# Altium project MainController.PrjPcb
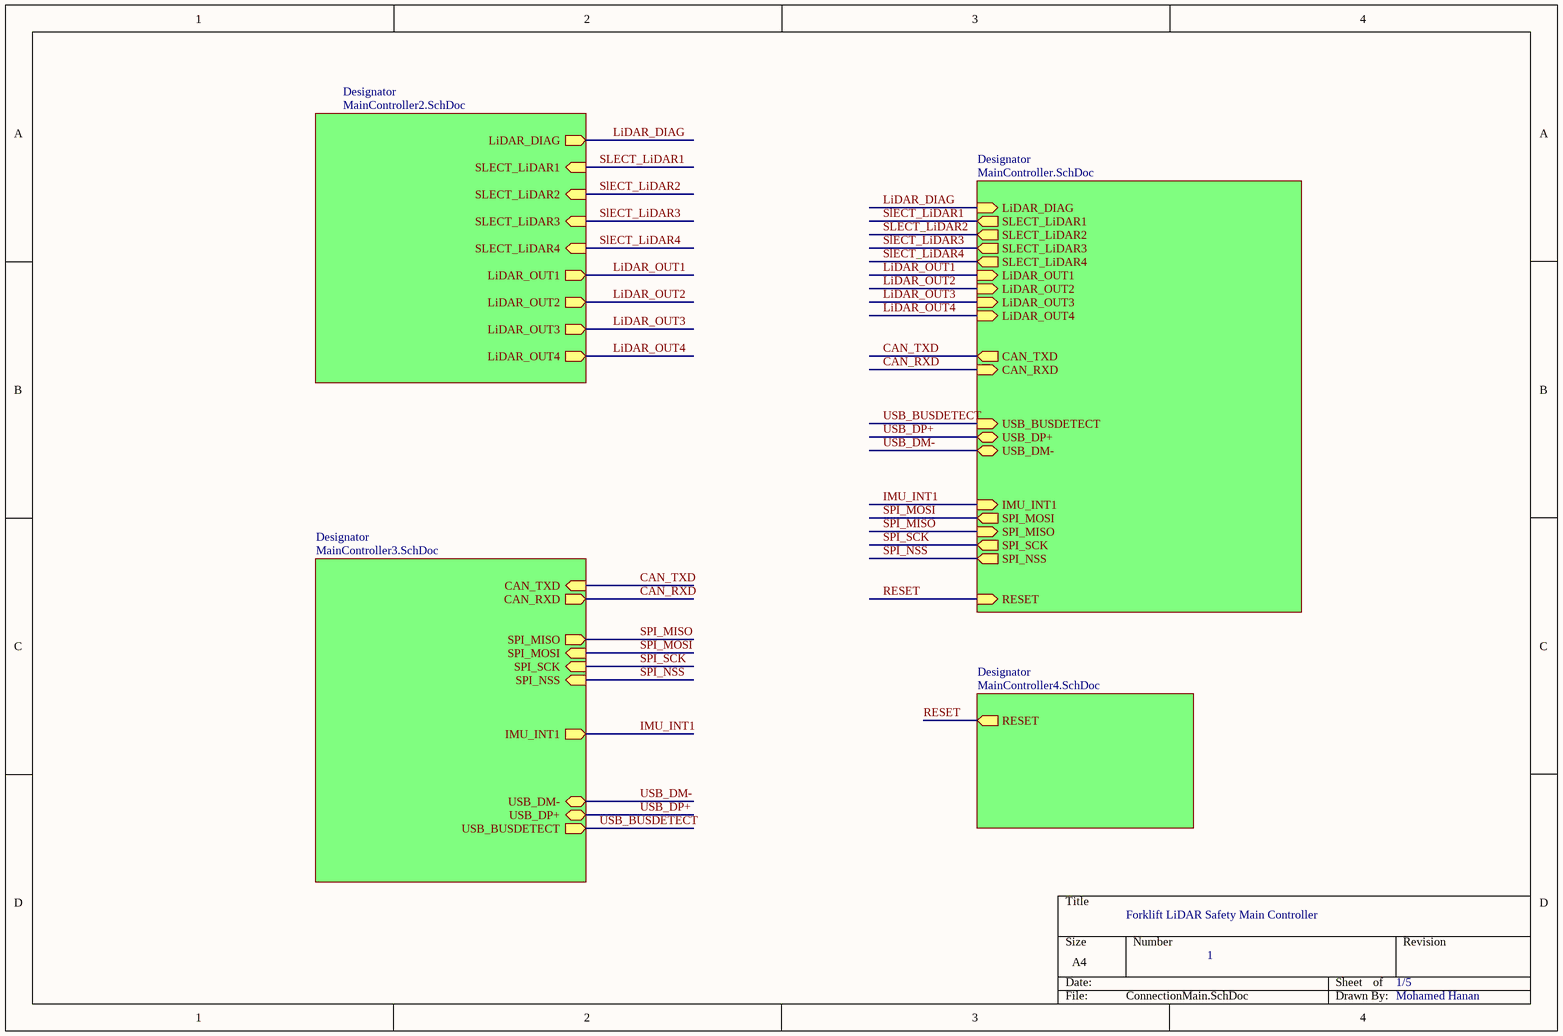
[diagram p0: ConnectionMain.SchDoc]
5 sheets, 112 parts. Net scope: hierarchical (ports join the sheet entries above them; power ports are global).
Board file: MainController.PcbDoc
Sheets:
  ConnectionMain.SchDoc
    Designator = MainController.SchDoc
    Designator = MainController2.SchDoc
    Designator = MainController3.SchDoc
    Designator = MainController4.SchDoc

## Sheet ConnectionMain.SchDoc
size A4; SheetNumber: 1; SheetTotal: 5

### Sub-sheets
Designator = MainController.SchDoc: LiDAR_DIAG (in), SLECT_LiDAR1 (out), SLECT_LiDAR2 (out), SLECT_LiDAR3 (out), SLECT_LiDAR4 (out), LiDAR_OUT1 (in), LiDAR_OUT2 (in), LiDAR_OUT3 (in), LiDAR_OUT4 (in), USB_DP+ (bidir), USB_DM- (bidir), IMU_INT1 (in), SPI_MOSI (out), SPI_MISO (in), SPI_SCK (out), SPI_NSS (out), CAN_TXD (out), CAN_RXD (in), USB_BUSDETECT (in), RESET (in)
Designator = MainController2.SchDoc: SLECT_LiDAR1 (in), SLECT_LiDAR2 (in), SLECT_LiDAR3 (in), SLECT_LiDAR4 (in), LiDAR_OUT1 (out), LiDAR_OUT2 (out), LiDAR_OUT3 (out), LiDAR_OUT4 (out), LiDAR_DIAG (out)
Designator = MainController3.SchDoc: CAN_TXD (in), CAN_RXD (out), USB_BUSDETECT (out), USB_DM- (bidir), USB_DP+ (bidir), IMU_INT1 (out), SPI_MISO (out), SPI_MOSI (in), SPI_SCK (in), SPI_NSS (in)
Designator = MainController4.SchDoc: RESET (out)

### Nets
CAN_RXD: sheet Designator/CAN_RXD, sheet Designator/CAN_RXD
CAN_TXD: sheet Designator/CAN_TXD, sheet Designator/CAN_TXD
IMU_INT1: sheet Designator/IMU_INT1, sheet Designator/IMU_INT1
LiDAR_DIAG: sheet Designator/LiDAR_DIAG, sheet Designator/LiDAR_DIAG
LiDAR_OUT1: sheet Designator/LiDAR_OUT1, sheet Designator/LiDAR_OUT1
LiDAR_OUT2: sheet Designator/LiDAR_OUT2, sheet Designator/LiDAR_OUT2
LiDAR_OUT3: sheet Designator/LiDAR_OUT3, sheet Designator/LiDAR_OUT3
LiDAR_OUT4: sheet Designator/LiDAR_OUT4, sheet Designator/LiDAR_OUT4
RESET: sheet Designator/RESET, sheet Designator/RESET
SLECT_LiDAR1: sheet Designator/SLECT_LiDAR1, sheet Designator/SLECT_LiDAR1
SlECT_LiDAR2: sheet Designator/SLECT_LiDAR2, sheet Designator/SLECT_LiDAR2
SlECT_LiDAR3: sheet Designator/SLECT_LiDAR3, sheet Designator/SLECT_LiDAR3
SlECT_LiDAR4: sheet Designator/SLECT_LiDAR4, sheet Designator/SLECT_LiDAR4
SPI_MISO: sheet Designator/SPI_MISO, sheet Designator/SPI_MISO
SPI_MOSI: sheet Designator/SPI_MOSI, sheet Designator/SPI_MOSI
SPI_NSS: sheet Designator/SPI_NSS, sheet Designator/SPI_NSS
SPI_SCK: sheet Designator/SPI_SCK, sheet Designator/SPI_SCK
USB_BUSDETECT: sheet Designator/USB_BUSDETECT, sheet Designator/USB_BUSDETECT
USB_DM-: sheet Designator/USB_DM-, sheet Designator/USB_DM-
USB_DP+: sheet Designator/USB_DP+, sheet Designator/USB_DP+

### Notes on the sheet
- Forklift LiDAR Safety Main Controller
- 1
- 1/5
- Mohamed Hanan

## Sheet MainController.SchDoc
size A4; SheetNumber: 2; SheetTotal: 5
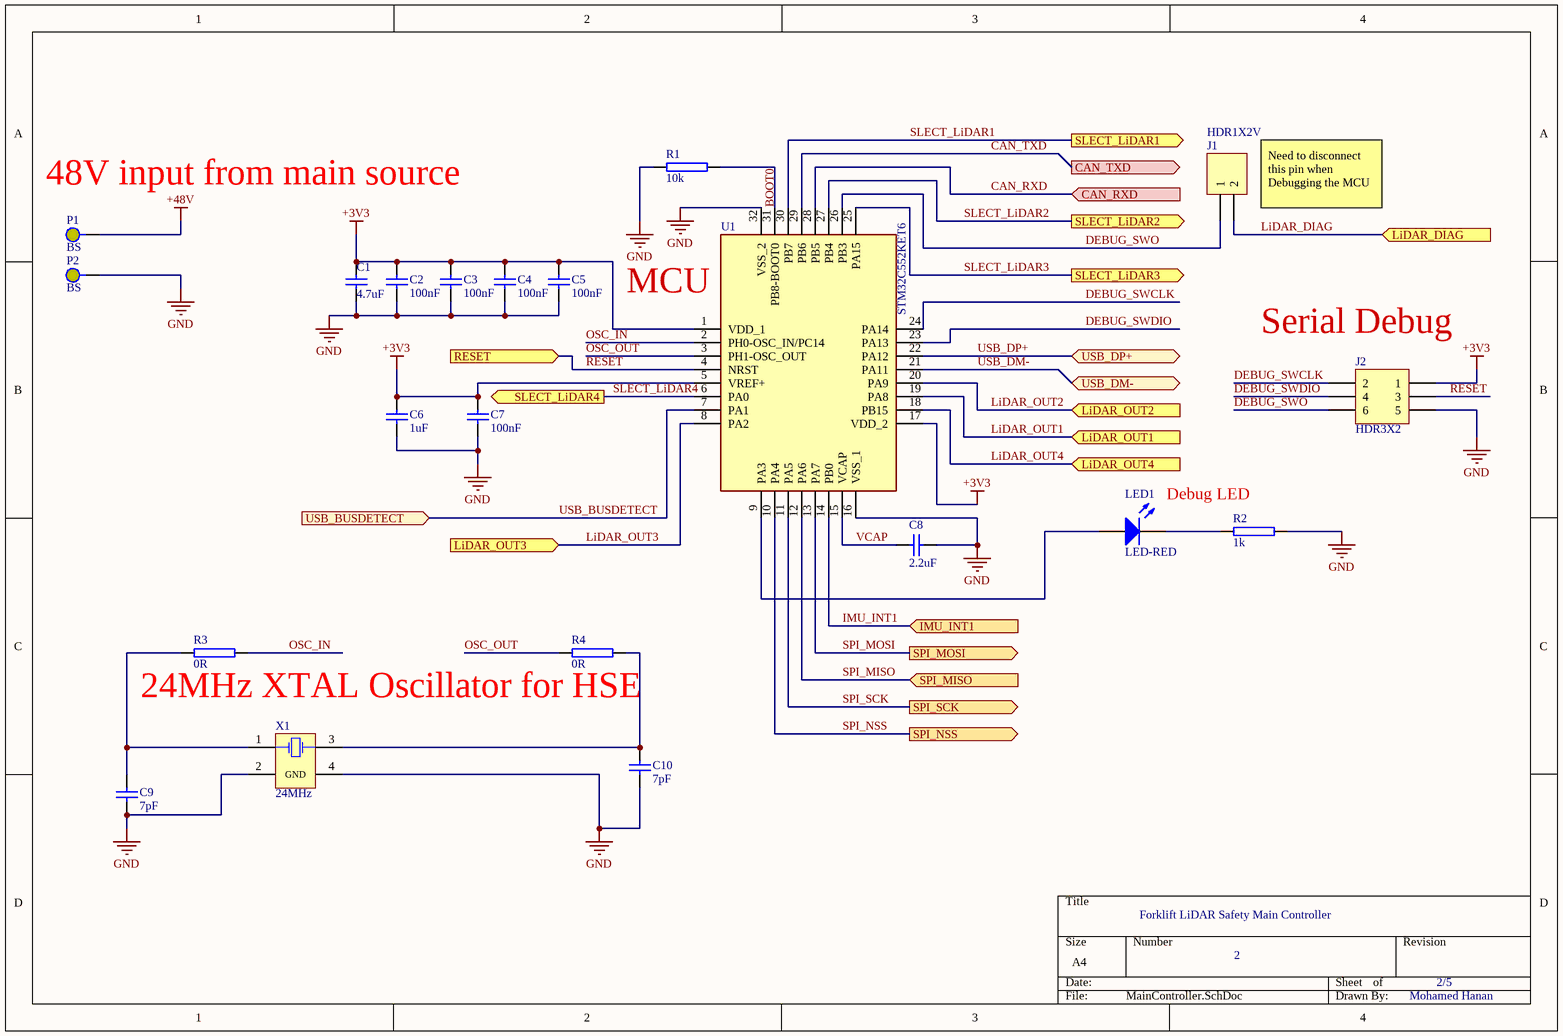
[diagram p1: MainController.SchDoc]

### Parts
C1  4.7uF  [CAP_1206]
C2  100nF  [CAP_0805]
C3  100nF  [CAP_0805]
C4  100nF  [CAP_0805]
C5  100nF  [CAP_0805]
C6  1uF  [CAP_0805]
C7  100nF  [CAP_0805]
C8  2.2uF  [CAP_0805]
C9  7pF  [CAP_0805]
C10  7pF  [CAP_0805]
J1  HDR1X2V  [HDR1X2_AUT]
J2  HDR3X2  [HDR2X3_AUT]
LED1  LED-RED  [LED1206R]
P1  BS  [Banana_AUT]
P2  BS  [Banana_AUT]
R1  10k  [RES_0805]
R2  1k  [RES_1206]
R3  0R  [RES_0805]
R4  0R  [RES_0805]
U1  STM32C552KET6  [32A_M]
X1  24MHz  [CX2520SB]

### Ports
CAN_RXD (in, see ConnectionMain[3B], MainController3[1A]), CAN_TXD (out, see ConnectionMain[3B], MainController3[1A]), IMU_INT1 (in, see ConnectionMain[3B], MainController3[4C]), LiDAR_DIAG (in, see ConnectionMain[3A], MainController2[3B]), LiDAR_OUT1 (in, see ConnectionMain[3B], MainController2[3C]), LiDAR_OUT2 (in, see ConnectionMain[3B], MainController2[3C]), LiDAR_OUT3 (in, see ConnectionMain[3B], MainController2[3D]), LiDAR_OUT4 (in, see ConnectionMain[3B], MainController2[3D]), RESET (in, see ConnectionMain[3C], MainController4[3C]), SLECT_LiDAR1 (out, see ConnectionMain[3A], MainController2[1B]), SLECT_LiDAR2 (out, see ConnectionMain[3A], MainController2[1B]), SLECT_LiDAR3 (out, see ConnectionMain[3A], MainController2[1B]), SLECT_LiDAR4 (out, see ConnectionMain[3B], MainController2[1B]), SPI_MISO (in, see ConnectionMain[3C], MainController3[4B]), SPI_MOSI (out, see ConnectionMain[3C], MainController3[4B]), SPI_NSS (out, see ConnectionMain[3C], MainController3[4B]), SPI_SCK (out, see ConnectionMain[3C], MainController3[4B]), USB_BUSDETECT (in, see ConnectionMain[3B], MainController3[2C]), USB_DM- (bidir, see ConnectionMain[3B], MainController3[2C]), USB_DP+ (bidir, see ConnectionMain[3B], MainController3[2C])

### Nets
+3V3: C1.2 C2.2 C3.2 C4.2 C5.2 C6.2 C7.2 J2.1 U1.1(VDD_1) U1.5(VREF+) U1.17(VDD_2)
+48V: P1.1
GND: C1.1 C2.1 C3.1 C4.1 C5.1 C6.1 C7.1 C8.2 C9.2 C10.2 J2.5 P2.1 R1.1 R2.2 U1.16(VSS_1) U1.32(VSS_2) X1.2(GND) X1.4(GND)
BOOT0: R1.2 U1.31(PB8-BOOT0)
CAN_RXD: U1.28(PB5) ; port CAN_RXD
CAN_TXD: U1.29(PB6) ; port CAN_TXD
DEBUG_SWCLK: J2.2 U1.24(PA14)
DEBUG_SWDIO: J2.4 U1.23(PA13)
DEBUG_SWO: J1.1 J2.6 U1.26(PB3)
IMU_INT1: U1.14(PB0) ; port IMU_INT1
LiDAR_DIAG: J1.2 ; port LiDAR_DIAG
LiDAR_OUT1: U1.19(PA8) ; port LiDAR_OUT1
LiDAR_OUT2: U1.20(PA9) ; port LiDAR_OUT2
LiDAR_OUT3: U1.8(PA2) ; port LiDAR_OUT3
LiDAR_OUT4: U1.18(PB15) ; port LiDAR_OUT4
OSC_IN: R3.2 U1.2(PH0-OSC_IN/PC14)
OSC_OUT: R4.1 U1.3(PH1-OSC_OUT)
RESET: J2.3 U1.4(NRST) ; port RESET
SLECT_LiDAR1: U1.30(PB7) ; port SLECT_LiDAR1
SlECT_LiDAR2: U1.27(PB4) ; port SLECT_LiDAR2
SlECT_LiDAR3: U1.25(PA15) ; port SLECT_LiDAR3
SlECT_LiDAR4: U1.6(PA0) ; port SLECT_LiDAR4
SPI_MISO: U1.12(PA6) ; port SPI_MISO
SPI_MOSI: U1.13(PA7) ; port SPI_MOSI
SPI_NSS: U1.10(PA4) ; port SPI_NSS
SPI_SCK: U1.11(PA5) ; port SPI_SCK
USB_BUSDETECT: U1.7(PA1) ; port USB_BUSDETECT
USB_DM-: U1.21(PA11) ; port USB_DM-
USB_DP+: U1.22(PA12) ; port USB_DP+
VCAP: C8.1 U1.15(VCAP)
NetC9_1: C9.1 R3.1 X1.1(OSC1)
NetC10_1: C10.1 R4.2 X1.3(OSC2)
NetLED1_A: LED1.A U1.9(PA3)
NetLED1_K: LED1.K R2.1

### Notes on the sheet
- (near P1) 48V input from main source
- (near J1) Need to disconnect this pin when Debugging the MCU
- (near U1) MCU
- (near J2) Serial Debug
- Debug LED
- 24MHz XTAL Oscillator for HSE
- Forklift LiDAR Safety Main Controller
- 2
- 2/5
- Mohamed Hanan

### Library data of the parts
C1 = CAPN 1206: Non Polarized Capacitor, SMD, 1206
C2-C10 = CAPN 0805: Non Polarized Capacitor, SMD, 0805
J1 = HDR1X2V: Header, Plug, 2.54mm, 2 Pins, Straight; Supplier 1: Farnell; Supplier Part Number 1: 2254030
J2 = HDR3X2: Header, 3-Pin, Dual row, 2.54mm Pitch, Straight; Supplier 1: Farnell; Supplier Part Number 1: 9733574
LED1 = SMD 1206 LED-RED: RED LED, Case 1206; Supplier 1: Farnell; Supplier Part Number 1: 8530017
P1 P2 = Banana Socket: Banana Socket, 4mm, Panel, Black, 10A; Supplier 1: Farnell; Supplier Part Number 1: 1101113
R1 R3 R4 = Resistor 0805: Resistor, SMD, 0805
R2 = Resistor 1206: Resistor, SMD, 1206
U1 = STM32C552KET6: Arm? Cortex?-M33 32-bit MCU with FPU, 144 MHz, 593 CoreMark?, up to 512Kbyte dualbank flash memory, 128-Kbyte RAM; Manufacturer_Name: STMicroelectronics; Geometry.Height: 1.6mm; Manufacturer_Part_Number: STM32C552KET6; Mouser Part Number: *; Mouser Price/Stock: *; Arrow Part Number: *; Arrow Price/Stock: *; Datasheet Link: https://www.st.com/resource/en/datasheet/stm32c551cc.pdf; Supplier 1: DigiKey; Supplier Part Number 1: 497-STM32C552KET6-ND
X1 = CX2520SB24000D0FLJZZ: Crystals, 24MHz; Supplier 1: Farnell; Supplier Part Number 1: 1657889

## Sheet MainController2.SchDoc
size A4; SheetNumber: 3; SheetTotal: 5
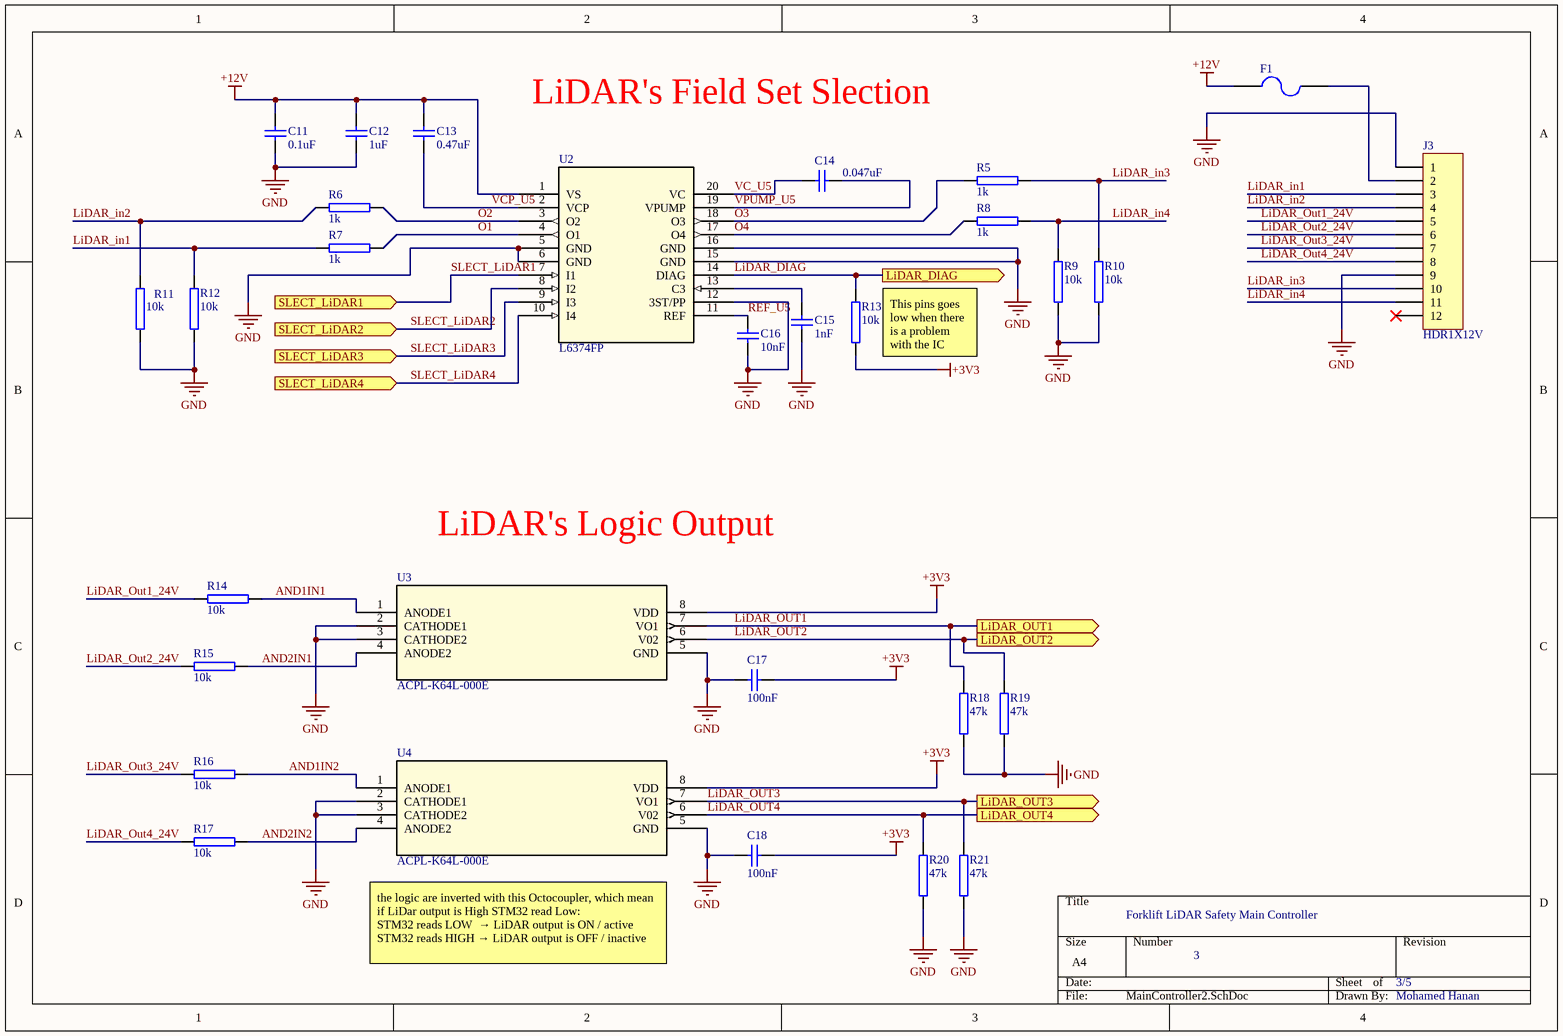
[diagram p2: MainController2.SchDoc]

### Parts
C11  0.1uF  [CAP_0805]
C12  1uF  [CAP_0805]
C13  0.47uF  [CAP_0805]
C14  0.047uF  [CAP_1206]
C15  1nF  [CAP_0805]
C16  10nF  [CAP_0805]
C17  100nF  [CAP_0805]
C18  100nF  [CAP_0805]
F1  1206L035/16YR  [MC36207]  (value not drawn)
J3  HDR1X12V  [HDR1X12_AUT]
R5  1k  [RES_1206]
R6  1k  [RES_1206]
R7  1k  [RES_1206]
R8  1k  [RES_1206]
R9  10k  [RES_0805]
R10  10k  [RES_0805]
R11  10k  [RES_0805]
R12  10k  [RES_0805]
R13  10k  [RES_0805]
R14  10k  [RES_0805]
R15  10k  [RES_0805]
R16  10k  [RES_0805]
R17  10k  [RES_0805]
R18  47k  [RES_0805]
R19  47k  [RES_0805]
R20  47k  [RES_0805]
R21  47k  [RES_0805]
U2  L6374FP  [20S_M]
U3  ACPL-K64L-000E  [STRETCHED_SO-8_AVA]
U4  ACPL-K64L-000E  [STRETCHED_SO-8_AVA]

### Ports
LiDAR_DIAG (out, see ConnectionMain[2A], MainController[4A]), LiDAR_OUT1 (out, see ConnectionMain[2B], MainController[3B]), LiDAR_OUT2 (out, see ConnectionMain[2B], MainController[3B]), LiDAR_OUT3 (out, see ConnectionMain[2B], MainController[2C]), LiDAR_OUT4 (out, see ConnectionMain[2B], MainController[3B]), SLECT_LiDAR1 (in, see ConnectionMain[2A], MainController[3A]), SLECT_LiDAR2 (in, see ConnectionMain[2A], MainController[3A]), SLECT_LiDAR3 (in, see ConnectionMain[2A], MainController[3B]), SLECT_LiDAR4 (in, see ConnectionMain[2A], MainController[2B])

### Nets
+3V3: C17.2 C18.2 R13.1 U3.8(VDD) U4.8(VDD)
+12V: C11.2 C12.2 C13.2 F1.1 U2.1(VS)
GND: C11.1 C12.1 C15.1 C16.1 C17.1 C18.1 J3.1 J3.9 R9.1 R10.1 R11.1 R12.1 R18.1 R19.1 R20.1 R21.1 U2.5(GND) U2.6(GND) U2.12(3ST/PP) U2.15(GND) U2.16(GND) U3.2(CATHODE1) U3.3(CATHODE2) U3.5(GND) U4.2(CATHODE1) U4.3(CATHODE2) U4.5(GND)
AND1IN1: R14.2 U3.1(ANODE1)
AND1IN2: R16.2 U4.1(ANODE1)
AND2IN1: R15.2 U3.4(ANODE2)
AND2IN2: R17.2 U4.4(ANODE2)
LiDAR_DIAG: R13.2 U2.14(DIAG) ; port LiDAR_DIAG
LiDAR_in1: J3.3 R7.1 R12.2
LiDAR_in2: J3.4 R6.1 R11.2
LiDAR_in3: J3.10 R5.2 R10.2
LiDAR_in4: J3.11 R8.2 R9.2
LiDAR_OUT1: R18.2 U3.7(VO1) ; port LiDAR_OUT1
LiDAR_Out1_24V: J3.5 R14.1
LiDAR_OUT2: R19.2 U3.6(V02) ; port LiDAR_OUT2
LiDAR_Out2_24V: J3.6 R15.1
LiDAR_OUT3: R21.2 U4.7(VO1) ; port LiDAR_OUT3
LiDAR_Out3_24V: J3.7 R16.1
LiDAR_OUT4: R20.2 U4.6(V02) ; port LiDAR_OUT4
LiDAR_Out4_24V: J3.8 R17.1
O1: R7.2 U2.4(O1)
O2: R6.2 U2.3(O2)
O3: R5.1 U2.18(O3)
O4: R8.1 U2.17(O4)
REF_U5: C16.2 U2.11(REF)
SLECT_LiDAR1: U2.7(I1) ; port SLECT_LiDAR1
SlECT_LiDAR2: U2.8(I2) ; port SLECT_LiDAR2
SlECT_LiDAR3: U2.9(I3) ; port SLECT_LiDAR3
SlECT_LiDAR4: U2.10(I4) ; port SLECT_LiDAR4
VC_U5: C14.1 U2.20(VC)
VCP_U5: C13.1 U2.2(VCP)
VPUMP_U5: C14.2 U2.19(VPUMP)
NetC15_2: C15.2 U2.13(C3)
NetF1_2: F1.2 J3.2

Not connected (* = marked no-connect by the designer): J3 12*

### Notes on the sheet
- LiDAR's Field Set Slection
- (near R13) This pins goes low when there is a problem with the IC
- LiDAR's Logic Output
- Forklift LiDAR Safety Main Controller
- the logic are inverted with this Octocoupler, which mean if LiDar output is High STM32 read Low:
  STM32 reads LOW  → LiDAR output is ON / active
  STM32 reads HIGH → LiDAR output is OFF / inactive
- 3
- 3/5
- Mohamed Hanan

### Library data of the parts
C11-C13 C15-C18 = CAPN 0805: Non Polarized Capacitor, SMD, 0805
C14 = CAPN 1206: Non Polarized Capacitor, SMD, 1206
F1 = 1206L035/16YR: Fuse, PTC Reset, 350mA Hold, 750mA Tripping, 16v; Supplier 1: Element14; Supplier Part Number 1: 1822203
J3 = HDR1X12V: Header, Plug, 2.54mm, 12 Pins, Straight; Supplier 1: Farnell; Supplier Part Number 1: 9732543
R5-R8 = Resistor 1206: Resistor, SMD, 1206
R9-R21 = Resistor 0805: Resistor, SMD, 0805
U2 = L6374FP: INDUSTRIAL QUAD LINE DRIVER; Manufacturer_Name: STMicroelectronics; Copyright: Copyright (C) 2025 Ultra Librarian. All rights reserved.; Manufacturer_Part_Number: L6374FP; RefDes: RefDes; Type: Type
U3 U4 = ACPL-K64L-000E: Description; Manufacturer_Name: Avago Technologies; Copyright: Copyright (C) 2026 Ultra Librarian. All rights reserved.; Manufacturer_Part_Number: ACPL-K64L-000E; RefDes: RefDes; Type: Type

## Sheet MainController3.SchDoc
size A4; SheetNumber: 4; SheetTotal: 5
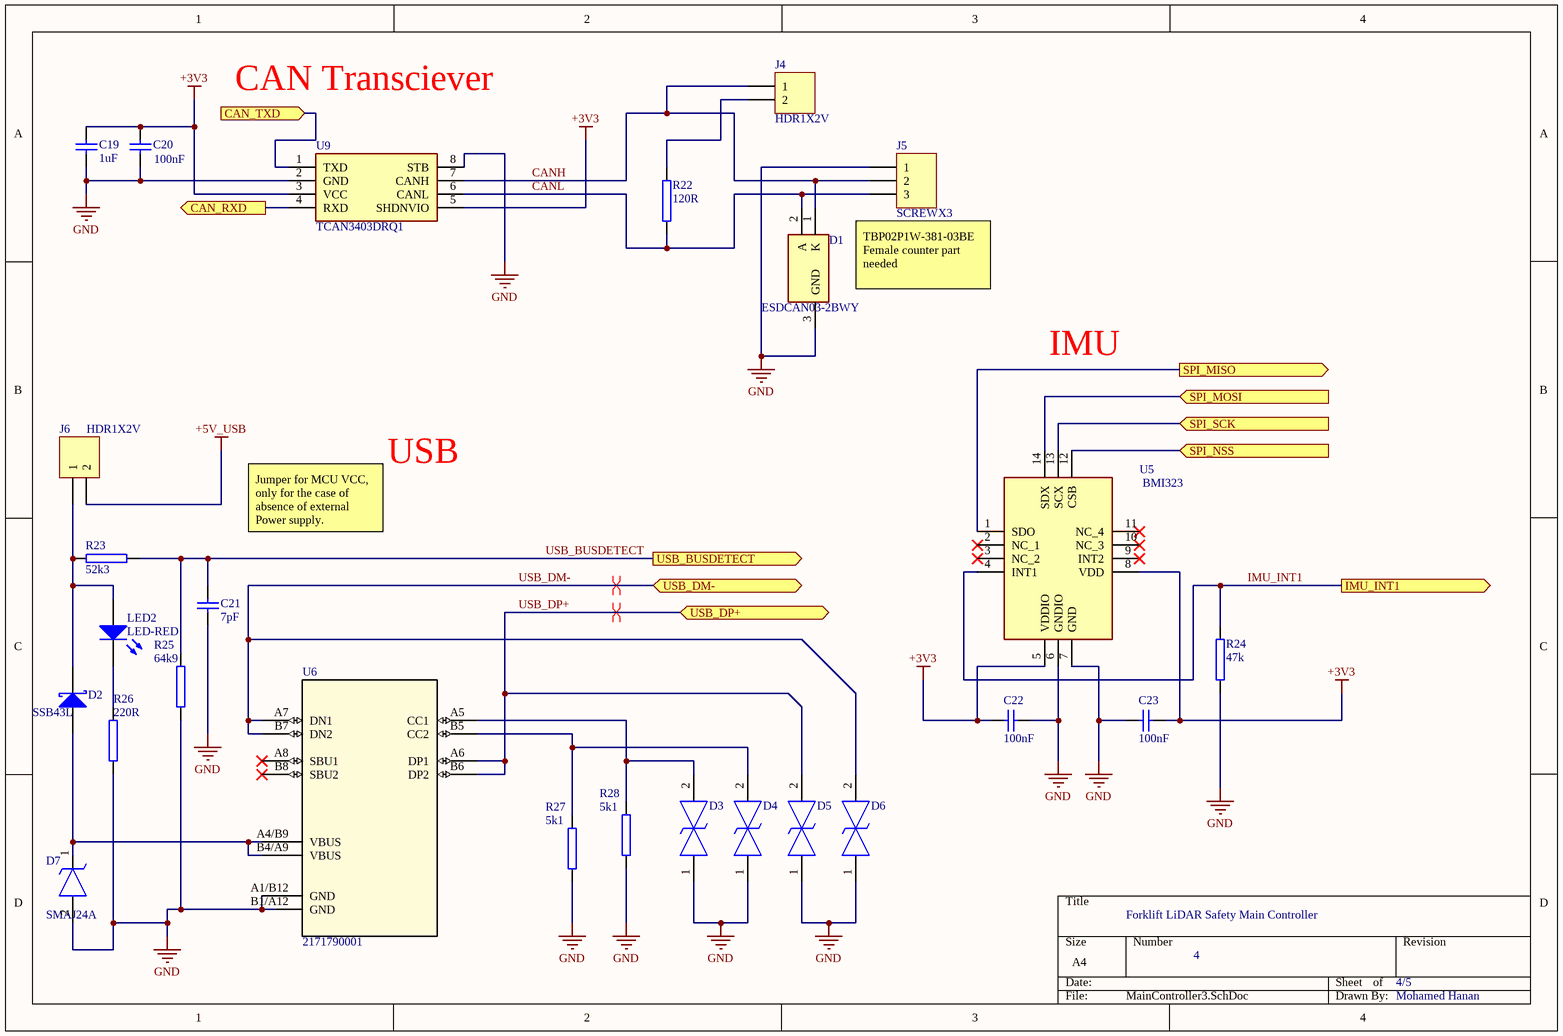
[diagram p3: MainController3.SchDoc]

### Parts
C19  1uF  [CAP_0805]
C20  100nF  [CAP_0805]
C21  7pF  [CAP_0805]
C22  100nF  [CAP_0805]
C23  100nF  [CAP_0805]
D1  ESDCAN03-2BWY  [SOT65P210X110-3N]
D2  SSB43L  [DO-214AA(SMB)]
D3  TSD05CDYFR  [SOD2613X100N]  (value not drawn)
D4  TSD05CDYFR  [SOD2613X100N]  (value not drawn)
D5  TSD05CDYFR  [SOD2613X100N]  (value not drawn)
D6  TSD05CDYFR  [SOD2613X100N]  (value not drawn)
D7  SMAJ24A  [DIOM5127X229N]
J4  HDR1X2V  [HDR1X2_AUT]
J5  SCREWX3  [SCREW3_AUT]
J6  HDR1X2V  [HDR1X2_AUT]
LED2  LED-RED  [LED1206R]
R22  120R  [RES_1206]
R23  52k3  [RES_0805]
R24  47k  [RES_0805]
R25  64k9  [RES_0805]
R26  220R  [RES_0805]
R27  5k1  [RES_0805]
R28  5k1  [RES_0805]
U5  BMI323  [BMI323]
U6  2171790001  [2171790001_MOL]
U9  TCAN3403DRQ1  [SOIC127P600X175-8N - duplicate]

### Ports
CAN_RXD (out, see ConnectionMain[2C], MainController[3A]), CAN_TXD (in, see ConnectionMain[2C], MainController[3A]), IMU_INT1 (out, see ConnectionMain[2C], MainController[3C]), SPI_MISO (out, see ConnectionMain[2C], MainController[3C]), SPI_MOSI (in, see ConnectionMain[2C], MainController[3C]), SPI_NSS (in, see ConnectionMain[2C], MainController[3C]), SPI_SCK (in, see ConnectionMain[2C], MainController[3C]), USB_BUSDETECT (out, see ConnectionMain[2D], MainController[1C]), USB_DM- (bidir, see ConnectionMain[2D], MainController[3B]), USB_DP+ (bidir, see ConnectionMain[2D], MainController[3B])

### Nets
+3V3: C19.2 C20.2 C22.1 C23.2 U5.5(VDDIO) U5.8(VDD) U9.3(VCC) U9.5(SHDNVIO)
+5V_USB: J6.2
GND: C19.1 C20.1 C21.1 C22.2 C23.1 D1.3(GND) D3.1 D4.1 D5.1 D6.1 D7.2(A) J5.1 R24.1 R25.1 R26.1 R27.1 R28.1 U5.6(GNDIO) U5.7(GND) U6.A1/B12(GND) U6.B1/A12(GND) U9.2(GND) U9.8(STB)
CAN_RXD: U9.4(RXD) ; port CAN_RXD
CAN_TXD: U9.1(TXD) ; port CAN_TXD
CANH: D1.1(K) J4.1 J5.2 U9.7(CANH)
CANL: D1.2(A) J5.3 R22.1 U9.6(CANL)
IMU_INT1: R24.2 U5.4(INT1) ; port IMU_INT1
SPI_MISO: U5.1(SDO) ; port SPI_MISO
SPI_MOSI: U5.14(SDX) ; port SPI_MOSI
SPI_NSS: U5.12(CSB) ; port SPI_NSS
SPI_SCK: U5.13(SCX) ; port SPI_SCK
USB_BUSDETECT: C21.2 R23.2 R25.2 ; port USB_BUSDETECT
USB_DM-: D6.2 U6.A7(DN1) U6.B7(DN2) ; port USB_DM-
USB_DP+: D5.2 U6.A6(DP1) U6.B6(DP2) ; port USB_DP+
NetD2_A: D2.A D7.1(K) U6.A4/B9(VBUS) U6.B4/A9(VBUS)
NetD2_K: D2.K J6.1 LED2.A R23.1
NetD3_2: D3.2 R28.2 U6.A5(CC1)
NetD4_2: D4.2 R27.2 U6.B5(CC2)
NetJ4_2: J4.2 R22.2
NetLED2_K: LED2.K R26.2

Not connected (* = marked no-connect by the designer): U5 2(NC_1)* 3(NC_2)* 9(INT2)* 10(NC_3)* 11(NC_4)*; U6 A8(SBU1)* B8(SBU2)*

### Layout directives
differential pair; differential pair class DIFF_USB: USB_DM-, USB_DP+

### Notes on the sheet
- CAN Transciever
- TBP02P1W-381-03BE
  Female counter part needed
- IMU
- USB
- Jumper for MCU VCC, only for the case of absence of external Power supply.
- Forklift LiDAR Safety Main Controller
- 4
- 4/5
- Mohamed Hanan

### Library data of the parts
C19-C23 = CAPN 0805: Non Polarized Capacitor, SMD, 0805
D1 = ESDCAN03-2BWY: TVS Diode (Uni-directional); Manufacturer_Name: STMicroelectronics; Datasheet Link: https://www.st.com/resource/en/datasheet/esdcan03-2bwy.pdf; Height: 1.1mm; Manufacturer_Part_Number: ESDCAN03-2BWY; Mouser Part Number: 511-ESDCAN03-2BWY; Mouser Price/Stock: https://www.mouser.co.uk/ProductDetail/STMicroelectronics/ESDCAN03-2BWY?qs=FqY30PPN9V2iiokjuqa22Q%3D%3D; Arrow Part Number: ESDCAN03-2BWY; Arrow Price/Stock: https://www.arrow.com/en/products/esdcan03-2bwy/stmicroelectronics.html?utm_currency=USD&region=europe
D2 = SSB43L: Schottky Diode, 4A, 30v; Supplier 1: Farnell; Supplier Part Number 1: 1336556
D3-D6 = TSD05CDYFR: TVS Diode (Bi-directional); Manufacturer_Name: Texas Instruments; Datasheet Link: https://www.ti.com/lit/ds/symlink/tsd05c.pdf?ts=1691730725852&ref_url=https%253A%252F%252Fwww.ti.com%252Fproduct%252FTSD05C%253FkeyMatch%253DTSD05CDYFR%2526tisearch%253Dsearch-everything%2526usecase%253DOPN; Height: 1mm; Manufacturer_Part_Number: TSD05CDYFR; Mouser Part Number: 595-TSD05CDYFR; Mouser Price/Stock: https://www.mouser.co.uk/ProductDetail/Texas-Instruments/TSD05CDYFR?qs=Imq1NPwxi74wAiGFX0POZQ%3D%3D; Arrow Part Number: TSD05CDYFR; Arrow Price/Stock: https://www.arrow.com/en/products/tsd05cdyfr/texas-instruments.html?utm_currency=USD&region=nac
D7 = SMAJ24A: TVS Diode (Uni-directional); Manufacturer_Name: Vishay; Datasheet Link: https://www.vishay.com/docs/88390/smaj50a.pdf; Height: 2.29mm; Manufacturer_Part_Number: SMAJ24A; Mouser Part Number: 78-SMAJ24A; Mouser Price/Stock: https://www.mouser.co.uk/ProductDetail/Vishay-General-Semiconductor/SMAJ24A?qs=N78E2i60HJ5M5XdBeXM0ag%3D%3D
J4 J6 = HDR1X2V: Header, Plug, 2.54mm, 2 Pins, Straight; Supplier 1: Farnell; Supplier Part Number 1: 2254030
J5 = SCREWX3: Terminal Block, PCB, 3Way, Pitch 5mm; Supplier 1: Farnell; Supplier Part Number 1: 9632689
LED2 = SMD 1206 LED-RED: RED LED, Case 1206; Supplier 1: Farnell; Supplier Part Number 1: 8530017
R22 = Resistor 1206: Resistor, SMD, 1206
R23-R28 = Resistor 0805: Resistor, SMD, 0805
U5 = BMI323: Integrated Circuit; Manufacturer_Name: BOSCH; Datasheet Link: https://www.bosch-sensortec.com/media/boschsensortec/downloads/datasheets/bst-bmi323-ds000.pdf; Height: 0.87mm; Manufacturer_Part_Number: BMI323; Mouser Part Number: 262-BMI323; Mouser Price/Stock: https://www.mouser.co.uk/ProductDetail/Bosch-Sensortec/BMI323?qs=By6Nw2ByBD3%2FE1v0UqNQPQ%3D%3D; Arrow Part Number: BMI323; Arrow Price/Stock: https://www.arrow.com/en/products/bmi323/bosch-sensortec?utm_currency=USD&region=nac
U6 = 2171790001: Universal Serial Bus (USB) Shielded I/O Receptacle, Type C, Right-Angle, Top Mount, Surface Mount, Single Row, 16 Circuits, Gold (Au) Plating; Manufacturer_Name: Molex Connector Corporation; Copyright: Copyright (C) 2025 Ultra Librarian. All rights reserved.; Manufacturer_Part_Number: 2171790001; RefDes: RefDes; Type: Type
U9 = TCAN3403DRQ1: Integrated Circuit; Manufacturer_Name: Texas Instruments; Datasheet Link: https://www.ti.com/lit/ds/symlink/tcan3403-q1.pdf?ts=1732780388772&ref_url=https%253A%252F%252Fwww.ti.com%252Fproduct%252FTCAN3403-Q1%252Fpart-details%252FTCAN3403DRQ1; Height: 1.75mm; Manufacturer_Part_Number: TCAN3403DRQ1; Mouser Part Number: 595-TCAN3403DRQ1; Mouser Price/Stock: https://www.mouser.co.uk/ProductDetail/Texas-Instruments/TCAN3403DRQ1?qs=VVKQmw408U8i3BeOClYB9g%3D%3D; Arrow Part Number: TCAN3403DRQ1; Arrow Price/Stock: https://www.arrow.com/en/products/tcan3403drq1/texas-instruments?utm_currency=USD&region=nac

## Sheet MainController4.SchDoc
size A4; SheetNumber: 5; SheetTotal: 5
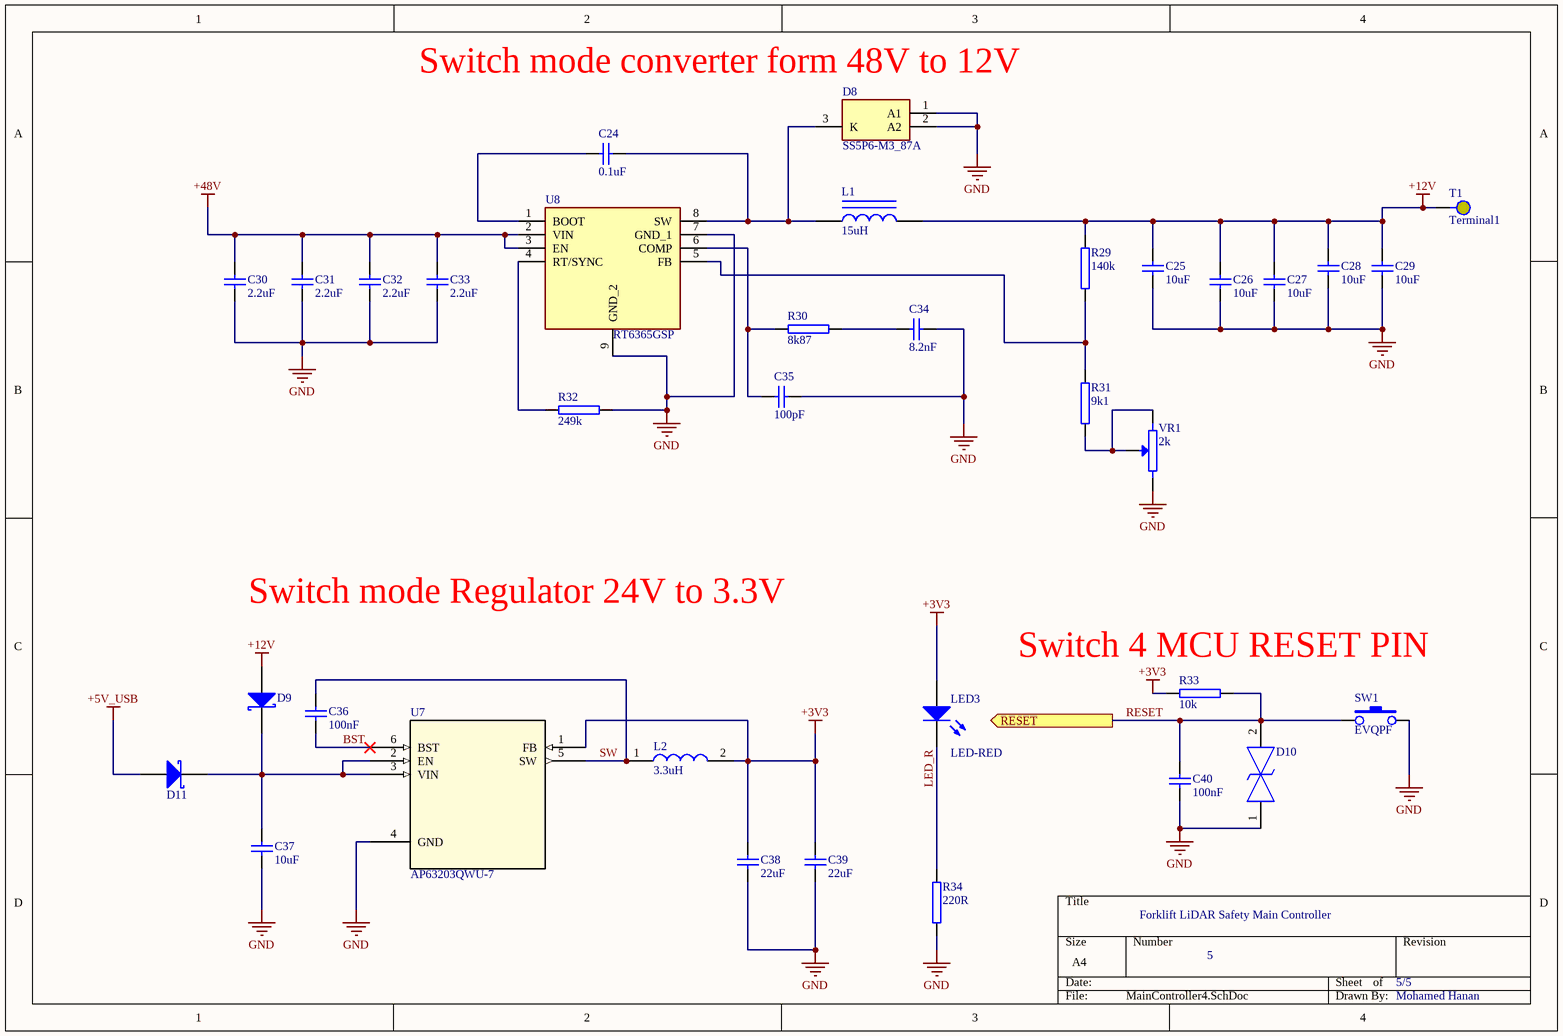
[diagram p4: MainController4.SchDoc]

### Parts
C24  0.1uF  [CAP_0805]
C25  10uF  [CAP_1206]
C26  10uF  [CAP_1206]
C27  10uF  [CAP_1206]
C28  10uF  [CAP_1206]
C29  10uF  [CAP_1206]
C30  2.2uF  [CAP_0805]
C31  2.2uF  [CAP_0805]
C32  2.2uF  [CAP_0805]
C33  2.2uF  [CAP_0805]
C34  8.2nF  [CAP_1206]
C35  100pF  [CAP_0805]
C36  100nF  [CAP_0805]
C37  10uF  [CAP_1206]
C38  22uF  [CAP_1206]
C39  22uF  [CAP_1206]
C40  100nF  [CAP_0805]
D8  SS5P6-M3_87A  [SS5P6M387A]
D9  PMEG3050BEP  [SOD-128]  (value not drawn)
D10  TSD05CDYFR  [SOD2613X100N]  (value not drawn)
D11  PMEG3050BEP  [SOD-128]  (value not drawn)
L1  15uH  [MSS1210]
L2  3.3uH  [SRP4020TA3R3M]
LED3  LED-RED  [LED1206R]
R29  140k  [RES_0805]
R30  8k87  [RES_0805]
R31  9k1  [RES_0805]
R32  249k  [RES_1206]
R33  10k  [RES_0805]
R34  220R  [RES_0805]
SW1  EVQPF  [EVQPF203M]
T1  Terminal1  [PAD1_AUT]
U7  AP63203QWU-7  [TSOT26_DIO]
U8  RT6365GSP  [SOIC127P600X175-9N]
VR1  2k  [3362S]

### Ports
RESET (out, see ConnectionMain[3C], MainController[2B])

### Nets
+3V3: C38.2 C39.2 L2.2 LED3.A R33.2 U7.1(FB)
+5V_USB: D11.A
+12V: C25.2 C26.2 C27.2 C28.2 C29.2 D9.A L1.2 R29.2 T1.1
+48V: C30.2 C31.2 C32.2 C33.2 U8.2(VIN) U8.3(EN)
GND: C25.1 C26.1 C27.1 C28.1 C29.1 C30.1 C31.1 C32.1 C33.1 C34.2 C35.2 C37.1 C38.1 C39.1 C40.1 D8.1(A1) D8.2(A2) D10.1 R32.2 R34.2 SW1.2 U7.4(GND) U8.7(GND_1) U8.9(GND_2) VR1.2(BOT)
BST: C36.1 U7.6(BST)
LED_R: LED3.K R34.1
RESET: C40.2 D10.2 R33.1 SW1.1 ; port RESET
SW: C36.2 L2.1 U7.5(SW)
NetC24_1: C24.1 U8.1(BOOT)
NetC24_2: C24.2 D8.3(K) L1.1 U8.8(SW)
NetC34_1: C34.1 R30.1
NetC35_1: C35.1 R30.2 U8.6(COMP)
NetC37_2: C37.2 D9.K D11.K U7.2(EN) U7.3(VIN)
NetR29_1: R29.1 R31.1 U8.5(FB)
NetR31_2: R31.2 VR1.1(TOP) VR1.W(TAP)
NetR32_1: R32.1 U8.4(RT/SYNC)

### Notes on the sheet
- (near D8) Switch mode converter form 48V to 12V
- Switch mode Regulator 24V to 3.3V
- (near R33) Switch 4 MCU RESET PIN
- Forklift LiDAR Safety Main Controller
- 5
- 5/5
- Mohamed Hanan

### Library data of the parts
C24 C30-C33 C35 C36 C40 = CAPN 0805: Non Polarized Capacitor, SMD, 0805
C25-C29 C34 C37-C39 = CAPN 1206: Non Polarized Capacitor, SMD, 1206
D8 = SS5P6-M3_87A: Schottky Diode; Manufacturer_Name: Vishay; Manufacturer_Part_Number: SS5P6-M3/87A; Datasheet Link: https://www.vishay.com/docs/88988/ss5p6.pdf; Height: 1.2mm; Mouser Part Number: 625-SS5P6-M3/87A; Mouser Price/Stock: https://www.mouser.co.uk/ProductDetail/Vishay-General-Semiconductor/SS5P6-M3-87A?qs=XGzIaZb%2FFYLx0h%2FWoI%2FVUQ%3D%3D; Arrow Part Number: SS5P6-M3/87A; Arrow Price/Stock: https://www.arrow.com/en/products/ss5p6-m387a/vishay?utm_currency=USD&region=nac
D9 D11 = PMEG3050BEP: Schottky REC, 30V, 5A, SMD; Supplier 1: Farnell; Supplier Part Number 1: 1829196
D10 = TSD05CDYFR: as D3 on sheet MainController3; Datasheet Link: https://www.ti.com/lit/ds/symlink/tsd05c.pdf?ts=1691730725852&ref_url=https%253A%252F%252Fwww.ti.com%252Fproduct%252FTSD05C%253FkeyMatch%253DTSD05CDYFR%2526tisearch%253Dsearch-everything%2526usecase%253DOPN; Height: 1mm; Manufacturer_Part_Number: TSD05CDYFR; Mouser Part Number: 595-TSD05CDYFR; Mouser Price/Stock: https://www.mouser.co.uk/ProductDetail/Texas-Instruments/TSD05CDYFR?qs=Imq1NPwxi74wAiGFX0POZQ%3D%3D; Arrow Part Number: TSD05CDYFR; Arrow Price/Stock: https://www.arrow.com/en/products/tsd05cdyfr/texas-instruments.html?utm_currency=USD&region=nac
L1 = MSS1210-153MED: Inductor, 15uH, 8.7A , AEC-Q200 MSS1210 Series; Supplier 1: Farnell; Supplier Part Number 1: 2288331
L2 = SRP4020TA-3R3M: Inductor; Manufacturer_Name: Bourns; Datasheet Link: https://www.bourns.com/docs/Product-Datasheets/SRP4020TA.pdf; Height: 2mm; Manufacturer_Part_Number: SRP4020TA-3R3M; Mouser Part Number: 652-SRP4020TA-3R3M; Mouser Price/Stock: https://www.mouser.co.uk/ProductDetail/Bourns/SRP4020TA-3R3M?qs=Ph8%2FHnX6CQx4K7XcRwo6CA%3D%3D; Arrow Part Number: SRP4020TA-3R3M; Arrow Price/Stock: https://www.arrow.com/en/products/srp4020ta-3r3m/bourns?region=nac
LED3 = SMD 1206 LED-RED: RED LED, Case 1206; Supplier 1: Farnell; Supplier Part Number 1: 8530017
R29-R31 R33 R34 = Resistor 0805: Resistor, SMD, 0805
R32 = Resistor 1206: Resistor, SMD, 1206
SW1 = EVQPF: PANASONIC  EVQPF203M  SWITCH, TACTILE, SPST-NO, 20mA, 15VDC; Supplier 1: Farnell; Supplier Part Number 1: 2079505
T1 = Terminal1: Terminal, Pad 70x70mil, Hole 32 mil
U7 = AP63203QWU-7: Description; Manufacturer_Name: Diodes Inc; Type: Power Management; Copyright: Copyright (C) 2026 Ultra Librarian. All rights reserved.; Manufacturer_Part_Number: AP63203QWU-7; RefDes: RefDes
U8 = RT6365GSP: Integrated Circuit; Manufacturer_Name: RICHTEK; Datasheet Link: https://www.richtek.com/assets/product_file/RT6365/DS6365-02.pdf; Height: 1.753mm; Manufacturer_Part_Number: RT6365GSP; Mouser Part Number: 835-RT6365GSP; Mouser Price/Stock: https://www.mouser.co.uk/ProductDetail/Richtek/RT6365GSP?qs=amGC7iS6iy%252BGHkAL3RFUug%3D%3D
VR1 = 3362S-1-202LF: 3362S Series, 1/4 ” Square  Potentiometer, 2k, 10%, 0.5 Watts, 1Turn; Supplier 1: Farnell; Supplier Part Number 1: 2321842

## Nets that join several sheets
+3V3: MainController (11 pins), MainController2 (5 pins), MainController3 (8 pins), MainController4 (6 pins)
+5V_USB: MainController3 (J6.2), MainController4 (D11.A)
+12V: MainController2 (5 pins), MainController4 (9 pins)
+48V: MainController (P1.1), MainController4 (6 pins)
GND: MainController (18 pins), MainController2 (27 pins), MainController3 (23 pins), MainController4 (25 pins)
CAN_RXD: MainController (U1.28), MainController3 (U9.4)
CAN_TXD: MainController (U1.29), MainController3 (U9.1)
IMU_INT1: MainController (U1.14), MainController3 (R24.2 U5.4)
LiDAR_DIAG: MainController (J1.2), MainController2 (R13.2 U2.14)
LiDAR_OUT1: MainController (U1.19), MainController2 (R18.2 U3.7)
LiDAR_OUT2: MainController (U1.20), MainController2 (R19.2 U3.6)
LiDAR_OUT3: MainController (U1.8), MainController2 (R21.2 U4.7)
LiDAR_OUT4: MainController (U1.18), MainController2 (R20.2 U4.6)
RESET: MainController (J2.3 U1.4), MainController4 (C40.2 D10.2 R33.1 SW1.1)
SLECT_LiDAR1: MainController (U1.30), MainController2 (U2.7)
SlECT_LiDAR2: MainController (U1.27), MainController2 (U2.8)
SlECT_LiDAR3: MainController (U1.25), MainController2 (U2.9)
SlECT_LiDAR4: MainController (U1.6), MainController2 (U2.10)
SPI_MISO: MainController (U1.12), MainController3 (U5.1)
SPI_MOSI: MainController (U1.13), MainController3 (U5.14)
SPI_NSS: MainController (U1.10), MainController3 (U5.12)
SPI_SCK: MainController (U1.11), MainController3 (U5.13)
USB_BUSDETECT: MainController (U1.7), MainController3 (C21.2 R23.2 R25.2)
USB_DM-: MainController (U1.21), MainController3 (D6.2 U6.A7 U6.B7)
USB_DP+: MainController (U1.22), MainController3 (D5.2 U6.A6 U6.B6)